# Altium project GNT604.PrjPcb
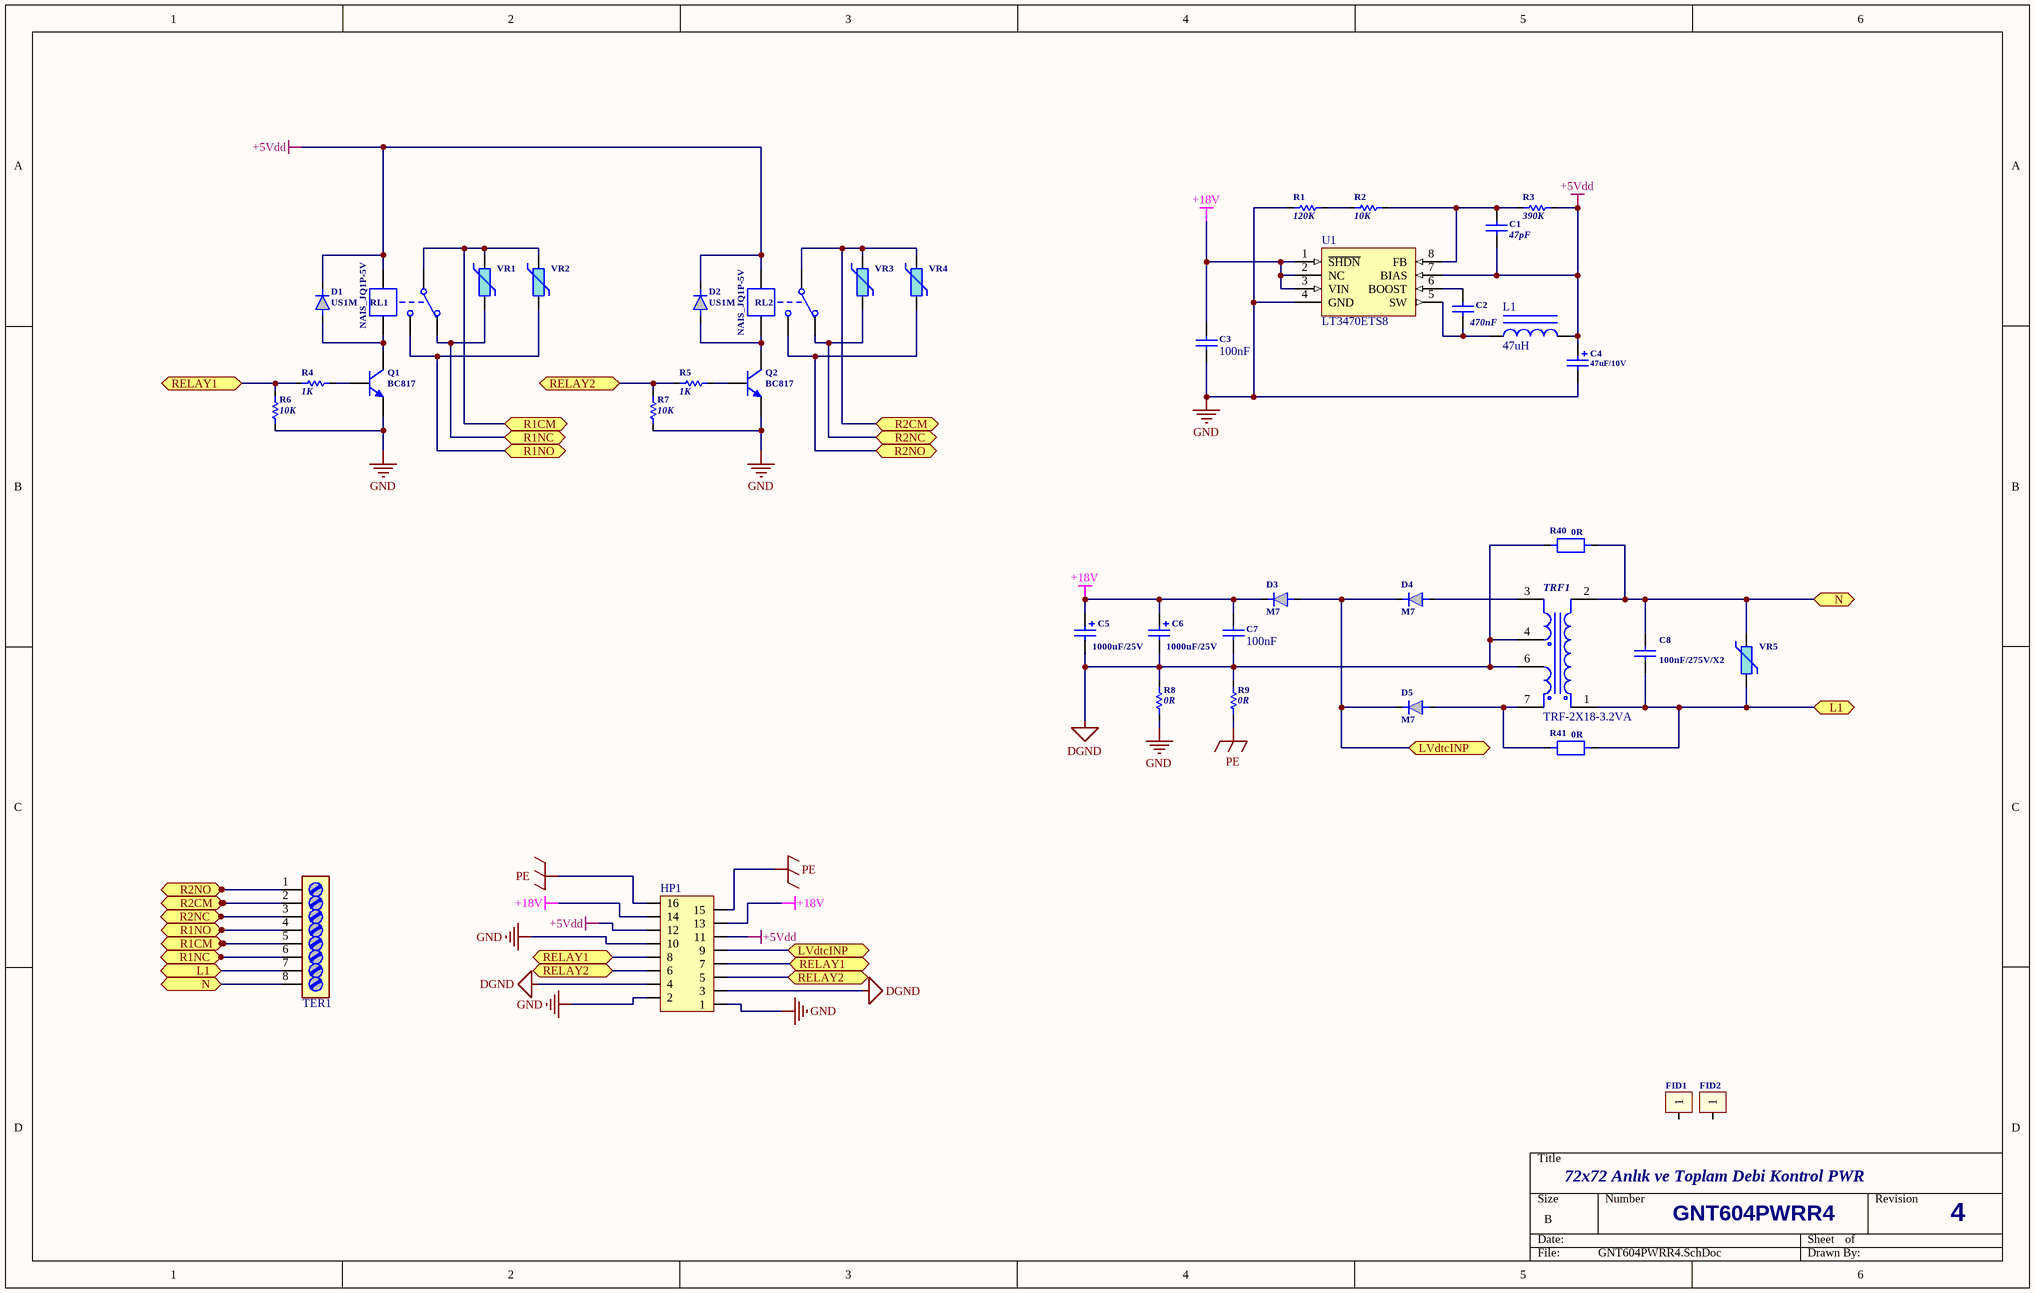
[diagram p0: GNT604PWRR4.SchDoc]
2 sheets, 139 parts. Net scope: flat (ports and power ports of the same name join across sheets).
Board files: GNT604CPUR4.PCBDOC, GNT604PWRR4.PCBDOC
Sheets:
  GNT604PWRR4.SchDoc
  GNT604CPUR4.SchDoc

## Sheet GNT604PWRR4.SchDoc
size B

### Parts
(Parts that share a designator on the sheet are numbered #1, #2 ... from top to bottom, then left to right.)
C1#1  47pF  [CC0805]
C2#1  470nF  [CC0805]
C3#1  100nF  [CC0805]
C4#1  47uF/10V  [CAPSMDTANTAL-B]
C5#1  1000uF/25V  [CAP5.08POL-10.16]
C6#1  1000uF/25V  [CAP5.08POL-10.16]
C7#1  100nF  [CC0805]
C8#1  100nF/275V/X2  [CAPAXIAL/275V/X2]
D1#1  US1M  [CD-SMA_DO214]
D2#1  US1M  [CD-SMA_DO214]
D3#1  M7  [CD-SMA_DO214]
D4#1  M7  [CD-SMA_DO214]
D5#1  M7  [CD-SMA_DO214]
FID1#1  FIDUCIAL1  [FIDUCIAL1]  (value not drawn)
FID2#1  FIDUCIAL1  [FIDUCIAL1]  (value not drawn)
HP1#1  DS1015-05_CONFLY  [HeaderAntenk90Pin16]  (value not drawn)
L1#1  47uH  [INDC2.5X3.3]
Q1#1  BC817  [SOT23_N]
Q2#1  BC817  [SOT23_N]
R1#1  120K  [CR0805]
R2#1  10K  [CR0805]
R3#1  390K  [CR0805]
R4#1  1K  [CR0805]
R5#1  1K  [CR0805]
R6#1  10K  [CR0805]
R7#1  10K  [CR0805]
R8#1  0R  [CR0805]
R9#1  0R  [CR0805]
R40  0R  [RES_AXIAL2W]
R41  0R  [RES_AXIAL2W]
RL1  NAIS_JQ1P-5V  [NAIS_JQ1P-XXV]
RL2  NAIS_JQ1P-5V  [NAIS_JQ1P-XXV]
TER1#1  Terminal_H5.08x8  [Terminal_H5.08x8]  (value not drawn)
TRF1  TRF-2X18-3.2VA  [TRF-EI38/13,5]
U1#1  LT3470ETS8  [TS8_N]
VR1  TVR07431  [TVR07431]  (value not drawn)
VR2  TVR07431  [TVR07431]  (value not drawn)
VR3  TVR07431  [TVR07431]  (value not drawn)
VR4  TVR07431  [TVR07431]  (value not drawn)
VR5  TVR07431  [TVR07431]  (value not drawn)

### Ports
L1 (bidir), LVdtcINP (bidir), N (bidir), R1CM (bidir), R1NC (bidir), R1NO (bidir), R2CM (bidir), R2NC (bidir), R2NO (bidir), RELAY1 (bidir), RELAY2 (bidir)

### Nets
+5Vdd: C1#1.2 C4#1.1(+) D1#1.2(K) D2#1.2(K) HP1#1.11 HP1#1.12 L1#1.2 R3#1.2 RL1.4(A1) RL2.4(A1) U1#1.7(BIAS)
+18V: C3#1.2 C5#1.1(+) C6#1.1(+) C7#1.2 D3#1.2(K) HP1#1.13 HP1#1.14 U1#1.1(~{SHDN}) U1#1.2(NC) U1#1.3(VIN)
DGND: C5#1.2(-) C6#1.2(-) C7#1.1 HP1#1.3 HP1#1.4 R8#1.1 R9#1.1 R40.1 TRF1.4(Sec1-) TRF1.6(Sec2+)
GND: C3#1.1 C4#1.2(-) HP1#1.1 HP1#1.2 HP1#1.10 Q1#1.2(E) Q2#1.2(E) R1#1.2 R6#1.2 R7#1.2 R8#1.2 U1#1.4(GND)
PE: HP1#1.15 HP1#1.16 R9#1.2
NetC1#1_1: C1#1.1 R2#1.1 R3#1.1 U1#1.8(FB)
NetC2#1_1: C2#1.1 U1#1.6(BOOST)
NetC2#1_2: C2#1.2 L1#1.1 U1#1.5(SW)
NetC8#1_1: C8#1.1 R40.2 TER1#1.8 TRF1.2(Pri-) VR5.2 ; port N
NetC8#1_2: C8#1.2 R41.2 TER1#1.7 TRF1.1(Pri+) VR5.1 ; port L1
NetD1#1_1: D1#1.1(A) Q1#1.3(C) RL1.5(A2)
NetD2#1_1: D2#1.1(A) Q2#1.3(C) RL2.5(A2)
NetD3#1_1: D3#1.1(A) D4#1.2(K) D5#1.2(K) HP1#1.9 ; port LVdtcINP
NetD4#1_1: D4#1.1(A) TRF1.3(Sec1+)
NetD5#1_1: D5#1.1(A) R41.1 TRF1.7(Sec2-)
NetHP1#1_5: HP1#1.5 HP1#1.6 R5#1.2 R7#1.1 ; port RELAY2
NetHP1#1_7: HP1#1.7 HP1#1.8 R4#1.2 R6#1.1 ; port RELAY1
NetQ1#1_1: Q1#1.1(B) R4#1.1
NetQ2#1_1: Q2#1.1(B) R5#1.1
NetR1#1_1: R1#1.1 R2#1.2
NetRL1_1: RL1.1(COM) TER1#1.5 VR1.2 VR2.2 ; port R1CM
NetRL1_2: RL1.2(NC) TER1#1.6 VR1.1 ; port R1NC
NetRL1_3: RL1.3(NO) TER1#1.4 VR2.1 ; port R1NO
NetRL2_1: RL2.1(COM) TER1#1.2 VR3.2 VR4.2 ; port R2CM
NetRL2_2: RL2.2(NC) TER1#1.3 VR3.1 ; port R2NC
NetRL2_3: RL2.3(NO) TER1#1.1 VR4.1 ; port R2NO

Not connected (* = marked no-connect by the designer): FID1#1 1; FID2#1 1

### Notes on the sheet
- 72x72 Anlık ve Toplam Debi Kontrol PWR
- GNT604PWRR4
- 4

### Library data of the parts
C1#1 C2#1 = CC-0805: Ceramic Chip Capacitor - Standard; Note: Footprint corresponds to dimensions for bulk cassette packaging. This case size has tightened tolerances.; Value: 100nF; Published: 17-Jul-2002; LatestRevisionDate: 19-Mar-2004; LatestRevisionNote: Silkscreen size reduced.; DatasheetDocument: Mar-2001; PackageDocument: Mar-2001; PackageReference: 0805; Publisher: Altium Limited; Code_JEITA: 0805; Code_IPC: 2012[0805]; ComponentLink1Description: Manufacturer Link; ComponentLink1URL: http://www.kemet.com/; ComponentLink2Description: Datasheet; ComponentLink2URL: http://www.kemet.com/kemet/web/homepage/kechome.nsf/vapubfilesname/F3102TA.pdf/$file/F3102TA.pdf
C3#1 C7#1 = CC-0805: Ceramic Chip Capacitor - Standard
C4#1 = CAPSMDTANTAL-B: CA45 Chip Tantalum Capacitors; Published: *; Publisher: *; Manufacturer: *; Class: *; SubClass: *
C5#1 C6#1 = CAP AXIAL POL10.16: Polarized Capacitor - Standard
C8#1 = CAP AXIAL SER: Ceramic Capacitor - Standard
D1#1 D2#1 = US1M: ChipDiodeSMA, ultra fast diode
D3#1 D4#1 D5#1 = CD-SMA_DO214: ChipDiodeSMA
HP1#1 = Header Antenk90PinF16: Header, 16-Pin, 90 DEGREES; Revision: 17-Jul-2002: Re-released for DXP Platform.; Publisher: Altium Limited
L1#1 = Inductor Iron_47uH: Magnetic-Core Inductor_SMD; Published: 24-Mar-1999; Revision: July-2002: Re-released for DXP Platform.; Publisher: Altium Limited
Q1#1 Q2#1 = BC817-40: NPN General Purpose Amplifier; Text Field7: Published 29-Sep-2000
R1#1 R2#1 R3#1 R4#1 R5#1 R6#1 R7#1 R8#1 R9#1 = CR-0805: ChipResistor0805; Published: 8-Jun-2000; LatestRevisionDate: 17-Jul-2002; LatestRevisionNote: Re-released for DXP Platform.; PackageReference: AXIAL-0.3; Publisher: Altium Limited
R40 R41 = RESISTOR AXIAL 2W: Axial Resistor 2W
RL1 RL2 = NAIS_JQ1P-24V: Single-Pole Dual-Throw Relay; Published: 24-Mar-1999; Revision: July-2002: Re-released for DXP Platform.; Publisher: Altium Limited
TER1#1 = Terminal_H5.08x8: Terminal Block Horizontal 5.08mm 8 pin
TRF1 = TRF-2X18-3.2VA: Text Field7: Published 8-Jun-2000
U1#1 = LT3470ETS8: 200mA, Micropower Buck Regulator; Note: 1916; Published: 30-May-2008; DatasheetVersion: Aug-2007; PackageVersion: revA, 2000; PackageReference: MS8; Publisher: Altium Limited; PackageDescription: 8-Pin Thin Small Outline Package 0.65 mm Pitch; ComponentLink1Description: Manufacturer Link; ComponentLink1URL: http://www.linear.com/; ComponentLink2Description: Datasheet; ComponentLink2URL: http://www.linear.com/pc/downloadDocument.do?navId=H0,C1,C1003,C1040,C1055,P1378,D3343
VR1-VR5 = TVR07431: Varistor (Voltage-Sensitive Resistor)-275V; Published: 24-Mar-1999; Revision: July-2002: Re-released for DXP Platform.; Publisher: Altium Limited

## Sheet GNT604CPUR4.SchDoc
size B
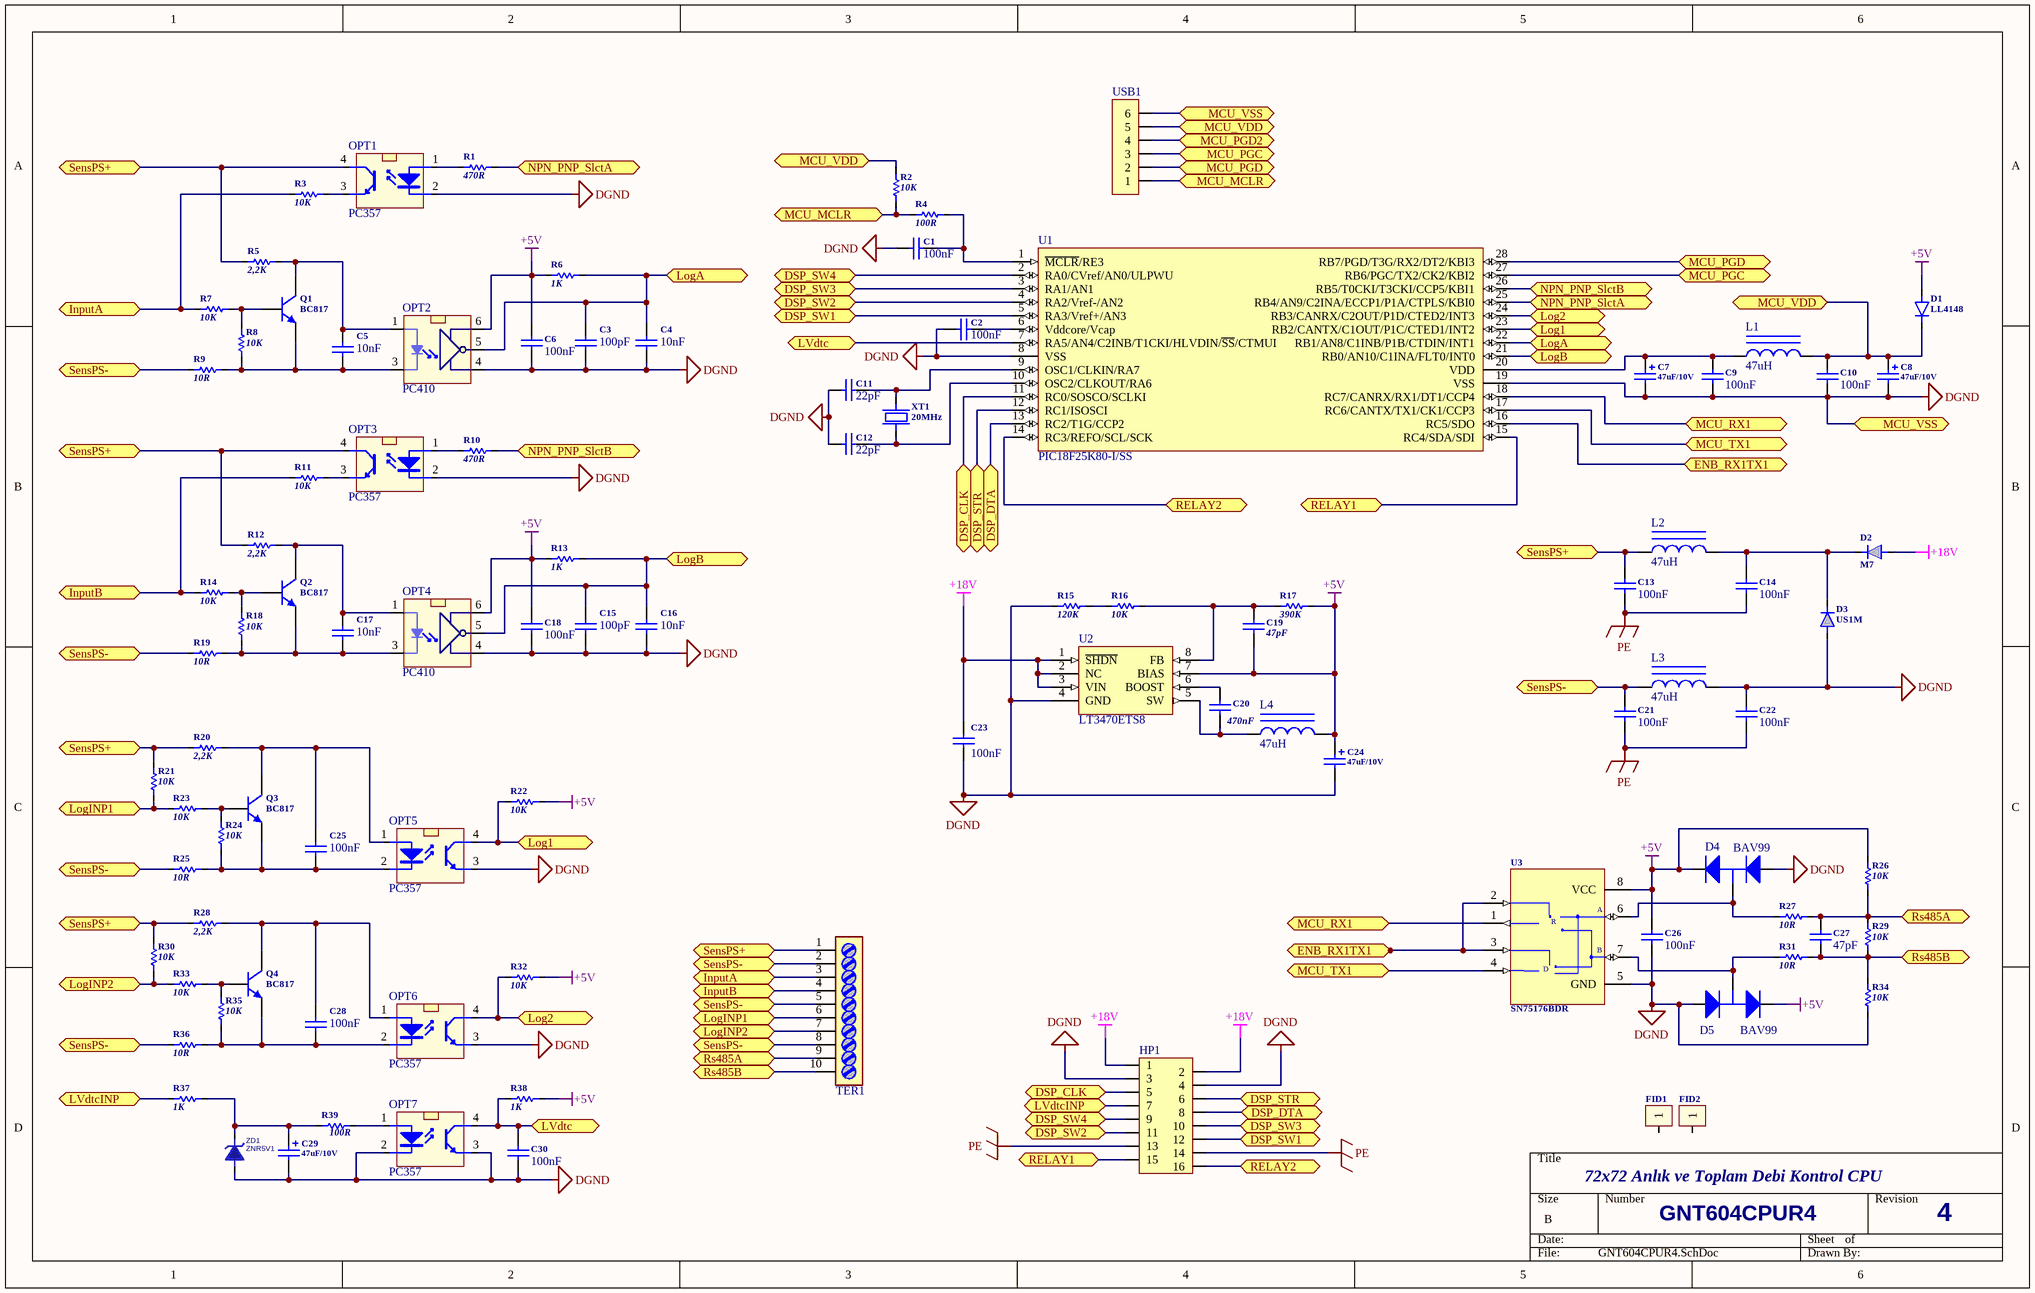
[diagram p1: GNT604CPUR4.SchDoc]

### Parts
(Parts that share a designator on the sheet are numbered #1, #2 ... from top to bottom, then left to right.)
C1#2  100nF  [CC0805]
C2#2  100nF  [CC0805]
C3#2  100pF  [CC0805]
C4#2  10nF  [CC0805]
C5#2  10nF  [CC0805]
C6#2  100nF  [CC0805]
C7#2  47uF/10V  [CAPSMDTANTAL-B]
C8#2  47uF/10V  [CAPSMDTANTAL-B]
C9  100nF  [CC0805]
C10  100nF  [CC0805]
C11  22pF  [CC0805]
C12  22pF  [CC0805]
C13  100nF  [CC0805]
C14  100nF  [CC0805]
C15  100pF  [CC0805]
C16  10nF  [CC0805]
C17  10nF  [CC0805]
C18  100nF  [CC0805]
C19  47pF  [CC0805]
C20  470nF  [CC0805]
C21  100nF  [CC0805]
C22  100nF  [CC0805]
C23  100nF  [CC0805]
C24  47uF/10V  [CAPSMDTANTAL-B]
C25  100nF  [CC0805]
C26  100nF  [CC0805]
C27  47pF  [CC0805]
C28  100nF  [CC0805]
C29  47uF/10V  [CAPSMDTANTAL-B]
C30  100nF  [CC0805]
D1#2  LL4148  [CD-SOD80]
D2#2  M7  [CD-SMA_DO214]
D3#2  US1M  [CD-SMA_DO214]
D4#2  BAV99  [SOT23_N]
D5#2  BAV99  [SOT23_N]
FID1#2  FIDUCIAL1  [FIDUCIAL1]  (value not drawn)
FID2#2  FIDUCIAL1  [FIDUCIAL1]  (value not drawn)
HP1#2  DS1015-05_CONFLY  [HeaderAntenk90Pin16]  (value not drawn)
L1#2  47uH  [INDC2.5X3.3]
L2  47uH  [INDC2.5X3.3]
L3  47uH  [INDC2.5X3.3]
L4  47uH  [INDC2.5X3.3]
OPT1  PC357  [SO-4]
OPT2  PC410  [SO-5]
OPT3  PC357  [SO-4]
OPT4  PC410  [SO-5]
OPT5  PC357  [SO-4]
OPT6  PC357  [SO-4]
OPT7  PC357  [SO-4]
Q1#2  BC817  [SOT23_N]
Q2#2  BC817  [SOT23_N]
Q3  BC817  [SOT23_N]
Q4  BC817  [SOT23_N]
R1#2  470R  [CR0805]
R2#2  10K  [CR0805]
R3#2  10K  [CR0805]
R4#2  100R  [CR0805]
R5#2  2,2K  [CR0805]
R6#2  1K  [CR0805]
R7#2  10K  [CR0805]
R8#2  10K  [CR0805]
R9#2  10R  [CR0805]
R10  470R  [CR0805]
R11  10K  [CR0805]
R12  2,2K  [CR0805]
R13  1K  [CR0805]
R14  10K  [CR0805]
R15  120K  [CR0805]
R16  10K  [CR0805]
R17  390K  [CR0805]
R18  10K  [CR0805]
R19  10R  [CR0805]
R20  2,2K  [CR0805]
R21  10K  [CR0805]
R22  10K  [CR0805]
R23  10K  [CR0805]
R24  10K  [CR0805]
R25  10R  [CR0805]
R26  10K  [CR0805]
R27  10R  [CR0805]
R28  2,2K  [CR0805]
R29  10K  [CR0805]
R30  10K  [CR0805]
R31  10R  [CR0805]
R32  10K  [CR0805]
R33  10K  [CR0805]
R34  10K  [CR0805]
R35  10K  [CR0805]
R36  10R  [CR0805]
R37  1K  [CR0805]
R38  1K  [CR0805]
R39  100R  [CR0805]
TER1#2  Terminal_H5.08x10  [Terminal_H5.08x10]  (value not drawn)
U1#2  PIC18F25K80-I/SS  [SSOP-SS28_N]
U2  LT3470ETS8  [TS8_N]
U3  SN75176BDR  [SO-8]
USB1  USB_MICRO  [MICRO_USB]  (value not drawn)
XT1  20MHz  [HC49/4H_SMX]
ZD1  ZNR5V1  [SOT23_N]

### Ports
DSP_CLK (bidir), DSP_DTA (bidir), DSP_STR (bidir), DSP_SW1 (bidir), DSP_SW2 (bidir), DSP_SW3 (bidir), DSP_SW4 (bidir), ENB_RX1TX1 (bidir), InputA (bidir), InputB (bidir), Log1 (bidir), Log2 (bidir), LogA (bidir), LogB (bidir), LogINP1 (bidir), LogINP2 (bidir), LVdtc (bidir), LVdtcINP (bidir), MCU_MCLR (bidir), MCU_PGC (bidir), MCU_PGD2 (bidir), MCU_PGD (bidir), MCU_RX1 (bidir), MCU_TX1 (bidir), MCU_VDD (bidir), MCU_VSS (bidir), NPN_PNP_SlctA (bidir), NPN_PNP_SlctB (bidir), RELAY1 (bidir), RELAY2 (bidir), Rs485A (bidir), Rs485B (bidir), SensPS+ (bidir), SensPS- (bidir)

### Nets
+5V: C6#2.1 C18.1 C19.2 C24.1(+) C26.1 D1#2.1(A) D4#2.2(K2) D5#2.2(K2) L4.2 OPT2.6 OPT4.6 R6#2.2 R13.2 R17.2 R22.2 R26.1 R32.2 R38.2 U2.7(BIAS) U3.8(VCC)
+18V: C23.2 D2#2.1(A) HP1#2.1 HP1#2.2 U2.1(~{SHDN}) U2.2(NC) U2.3(VIN)
DGND: C1#2.2 C2#2.2 C3#2.2 C4#2.2 C6#2.2 C7#2.2(-) C8#2.2(-) C9.1 C10.1 C11.2 C12.2 C15.2 C16.2 C18.2 C22.2 C23.1 C24.2(-) C26.2 C29.2(-) C30.2 D3#2.1(A) D4#2.1(A1) D5#2.1(A1) HP1#2.3 HP1#2.4 L3.2 OPT1.2(K) OPT2.4 OPT3.2(K) OPT4.4 OPT5.3(E) OPT6.3(E) OPT7.2(K) OPT7.3(E) R15.2 R34.2 U1#2.8(VSS) U1#2.19(VSS) U2.4(GND) U3.5(GND) USB1.6 ZD1.1(A) ; port MCU_VSS
PE: C13.1 C14.1 C21.1 C22.1 HP1#2.13 HP1#2.14
NetC1#2_1: C1#2.1 R4#2.1 U1#2.1(~{MCLR}/RE3)
NetC2#2_1: C2#2.1 U1#2.6(Vddcore/Vcap)
NetC3#2_1: C3#2.1 C4#2.1 OPT2.5 R6#2.1 U1#2.22(RB1/AN8/C1INB/P1B/CTDIN/INT1) ; port LogA
NetC5#2_1: C5#2.1 OPT2.1 Q1#2.3(C) R5#2.1
NetC5#2_2: C5#2.2 OPT2.3 Q1#2.2(E) R8#2.2 R9#2.1
NetC7#2_1: C7#2.1(+) C9.2 L1#2.1 U1#2.20(VDD)
NetC8#2_1: C8#2.1(+) C10.2 D1#2.2(K) L1#2.2 R2#2.1 USB1.5 ; port MCU_VDD
NetC11_1: C11.1 U1#2.9(OSC1/CLKIN/RA7) XT1.1
NetC12_1: C12.1 U1#2.10(OSC2/CLKOUT/RA6) XT1.2
NetC13_2: C13.2 L2.1 OPT1.4(C) OPT3.4(C) R5#2.2 R12.2 R20.1 R21.1 R28.1 R30.1 TER1#2.1 ; port SensPS+
NetC14_2: C14.2 D2#2.2(K) D3#2.2(K) L2.2
NetC15_1: C15.1 C16.1 OPT4.5 R13.1 U1#2.21(RB0/AN10/C1INA/FLT0/INT0) ; port LogB
NetC17_1: C17.1 OPT4.1 Q2#2.3(C) R12.1
NetC17_2: C17.2 OPT4.3 Q2#2.2(E) R18.2 R19.1
NetC19_1: C19.1 R16.1 R17.1 U2.8(FB)
NetC20_1: C20.1 U2.6(BOOST)
NetC20_2: C20.2 L4.1 U2.5(SW)
NetC21_2: C21.2 L3.1 R9#2.2 R19.2 R25.2 R36.2 TER1#2.2 TER1#2.5 TER1#2.8 ; port SensPS-
NetC25_1: C25.1 OPT5.1(A) Q3.3(C) R20.2
NetC25_2: C25.2 OPT5.2(K) Q3.2(E) R24.2 R25.1
NetC27_1: C27.1 R29.2 R31.1 R34.1 TER1#2.10 ; port Rs485B
NetC27_2: C27.2 R26.2 R27.1 R29.1 TER1#2.9 ; port Rs485A
NetC28_1: C28.1 OPT6.1(A) Q4.3(C) R28.2
NetC28_2: C28.2 OPT6.2(K) Q4.2(E) R35.2 R36.1
NetC29_1: C29.1(+) R37.2 R39.1 ZD1.3(K)
NetC30_1: C30.1 OPT7.4(C) R38.1 U1#2.7(RA5/AN4/C2INB/T1CKI/HLVDIN/~{SS}/CTMUI) ; port LVdtc
NetD3#1_1: HP1#2.7 R37.1 ; port LVdtcINP
NetD4#2_3: D4#2.3(AK) R27.2 U3.6(A)
NetD5#2_3: D5#2.3(AK) R31.2 U3.7(B)
NetHP1#1_5: HP1#2.16 U1#2.14(RC3/REFO/SCL/SCK) ; port RELAY2
NetHP1#1_7: HP1#2.15 U1#2.15(RC4/SDA/SDI) ; port RELAY1
NetHP1#2_5: HP1#2.5 U1#2.11(RC0/SOSCO/SCLKI) ; port DSP_CLK
NetHP1#2_6: HP1#2.6 U1#2.12(RC1/ISOSCI) ; port DSP_STR
NetHP1#2_8: HP1#2.8 U1#2.13(RC2/T1G/CCP2) ; port DSP_DTA
NetHP1#2_9: HP1#2.9 U1#2.2(RA0/CVref/AN0/ULPWU) ; port DSP_SW4
NetHP1#2_10: HP1#2.10 U1#2.3(RA1/AN1) ; port DSP_SW3
NetHP1#2_11: HP1#2.11 U1#2.4(RA2/Vref-/AN2) ; port DSP_SW2
NetHP1#2_12: HP1#2.12 U1#2.5(RA3/Vref+/AN3) ; port DSP_SW1
NetOPT1_1: OPT1.1(A) R1#2.2
NetOPT1_3: OPT1.3(E) R3#2.2
NetOPT3_1: OPT3.1(A) R10.2
NetOPT3_3: OPT3.3(E) R11.2
NetOPT5_4: OPT5.4(C) R22.1 U1#2.23(RB2/CANTX/C1OUT/P1C/CTED1/INT2) ; port Log1
NetOPT6_4: OPT6.4(C) R32.1 U1#2.24(RB3/CANRX/C2OUT/P1D/CTED2/INT3) ; port Log2
NetOPT7_1: OPT7.1(A) R39.2
NetQ1#2_1: Q1#2.1(B) R7#2.1 R8#2.1
NetQ2#2_1: Q2#2.1(B) R14.1 R18.1
NetQ3_1: Q3.1(B) R23.2 R24.1
NetQ4_1: Q4.1(B) R33.2 R35.1
NetR1#2_1: R1#2.1 U1#2.25(RB4/AN9/C2INA/ECCP1/P1A/CTPLS/KBI0) ; port NPN_PNP_SlctA
NetR2#2_2: R2#2.2 R4#2.2 USB1.1 ; port MCU_MCLR
NetR3#2_1: R3#2.1 R7#2.2 TER1#2.3 ; port InputA
NetR10_1: R10.1 U1#2.26(RB5/T0CKI/T3CKI/CCP5/KBI1) ; port NPN_PNP_SlctB
NetR11_1: R11.1 R14.2 TER1#2.4 ; port InputB
NetR15_1: R15.1 R16.2
NetR21_2: R21.2 R23.1 TER1#2.6 ; port LogINP1
NetR30_2: R30.2 R33.1 TER1#2.7 ; port LogINP2
NetU1#2_16: U1#2.16(RC5/SDO) U3.2(~{RE}) U3.3(DE) ; port ENB_RX1TX1
NetU1#2_17: U1#2.17(RC6/CANTX/TX1/CK1/CCP3) U3.4(DI) ; port MCU_TX1
NetU1#2_18: U1#2.18(RC7/CANRX/RX1/DT1/CCP4) U3.1(RO) ; port MCU_RX1
NetU1#2_27: U1#2.27(RB6/PGC/TX2/CK2/KBI2) USB1.3 ; port MCU_PGC
NetU1#2_28: U1#2.28(RB7/PGD/T3G/RX2/DT2/KBI3) USB1.2 ; port MCU_PGD
NetUSB1_4: USB1.4 ; port MCU_PGD2

Not connected (* = marked no-connect by the designer): FID1#2 1; FID2#2 1

### Notes on the sheet
- 72x72 Anlık ve Toplam Debi Kontrol CPU
- GNT604CPUR4
- 4
- (in symbol SN75176BDR) R; D

### Library data of the parts
C1#2 C2#2 C3#2 C4#2 C5#2 C6#2 C9-C18 C21-C23 C25-C28 C30 = CC-0805: Ceramic Chip Capacitor - Standard
C7#2 C8#2 C24 C29 = CAPSMDTANTAL-B: CA45 Chip Tantalum Capacitors; Published: *; Publisher: *; Manufacturer: *; Class: *; SubClass: *
C19 C20 = CC-0805: as C1#1 on sheet GNT604PWRR4; Published: 17-Jul-2002; LatestRevisionDate: 19-Mar-2004; LatestRevisionNote: Silkscreen size reduced.; DatasheetDocument: Mar-2001; PackageDocument: Mar-2001; PackageReference: 0805; Publisher: Altium Limited; Code_JEITA: 0805; Code_IPC: 2012[0805]; ComponentLink1Description: Manufacturer Link; ComponentLink1URL: http://www.kemet.com/; ComponentLink2Description: Datasheet; ComponentLink2URL: http://www.kemet.com/kemet/web/homepage/kechome.nsf/vapubfilesname/F3102TA.pdf/$file/F3102TA.pdf
D1#2 = CD-SOD80: ChipDiode-MiniMELF-SOD80
D2#2 = CD-SMA_DO214: ChipDiodeSMA
D3#2 = US1M: ChipDiodeSMA, ultra fast diode
D4#2 D5#2 = BAV99: Ultrafast, Soft Recovery Diode
HP1#2 = Header Antenk90PinF16: Header, 16-Pin, 90 DEGREES; Revision: 17-Jul-2002: Re-released for DXP Platform.; Publisher: Altium Limited
L1#2 L2-L4 = Inductor Iron_47uH: Magnetic-Core Inductor_SMD; Published: 24-Mar-1999; Revision: July-2002: Re-released for DXP Platform.; Publisher: Altium Limited
OPT1 OPT3 OPT5-OPT7 = PC357: Optoisolator
OPT2 OPT4 = PC410: Ultra-high Speed Response  OPIC Photocoupler
Q1#2 Q2#2 Q3 Q4 = BC817-40: as Q1#1 on sheet GNT604PWRR4
R1#2 R2#2 R3#2 R4#2 R5#2 R6#2 R7#2 R8#2 R9#2 R10-R39 = CR-0805: ChipResistor0805; Published: 8-Jun-2000; LatestRevisionDate: 17-Jul-2002; LatestRevisionNote: Re-released for DXP Platform.; PackageReference: AXIAL-0.3; Publisher: Altium Limited
TER1#2 = Terminal_H5.08x10: Terminal Block Horizontal 5.08mm 10 pin
U1#2 = PIC18F25K80-I/SS: Flash Microcontroller with 10-Bit A/D and nanoWatt Technology, 32K Flash, 28-Pin SSOP, Industrial Temperature Range, Tape and Reel; FirstPublished: 29-Jan-2009; LatestRevisionDate: 02-Dec-2009; LatestRevisionNote: Updated to datasheet revision F, Sep-2009; DatasheetVersion: revF, Sep-2009; PackageVersion: revBB, Aug-2009; PackageReference: SSOP-SS28; Publisher: Altium Limited; PackageDescription: 28-Lead Plastic Shrink Small Outline (SS) - 5.3mm Body [SSOP]; Supplier 1: Digi-Key; Supplier Part Number 1: PIC18F25K20T-I/SSTR-ND; Supplier 2: Digi-Key; Supplier Part Number 2: PIC18F25K20T-I/SSCT-ND; Supplier 3: Digi-Key; Supplier Part Number 3: PIC18F25K20T-I/SSDKR-ND; Supplier 4: Newark; Supplier Part Number 4: 88K5991; Code_JEDEC: MS-150; Code_IPC: SOP65P780-28; ComponentLink1Description: Datasheet; ComponentLink1URL: http://ww1.microchip.com/downloads/en/DeviceDoc/41303F.pdf; ComponentLink2Description: Packaging Specification; ComponentLink2URL: http://www.microchip.com/stellent/groups/techpub_sg/documents/packagingspec/en012702.pdf; ComponentLink3Description: Microchip.com Home; ComponentLink3URL: http://www.microchip.com/
U2 = LT3470ETS8: as U1#1 on sheet GNT604PWRR4; Published: 30-May-2008; DatasheetVersion: Aug-2007; PackageVersion: revA, 2000; PackageReference: MS8; Publisher: Altium Limited; PackageDescription: 8-Pin Thin Small Outline Package 0.65 mm Pitch; ComponentLink1Description: Manufacturer Link; ComponentLink1URL: http://www.linear.com/; ComponentLink2Description: Datasheet; ComponentLink2URL: http://www.linear.com/pc/downloadDocument.do?navId=H0,C1,C1003,C1040,C1055,P1378,D3343
U3 = SN75176BDR: Low-Power,RS-485/RS-422 Transceiver; PackageDocument: RevB, 21-0043; Published: 16-Jan-2001; LatestRevisionDate: 6-Jun-2005; LatestRevisionNote: Stylized 3D Model Added.; DatasheetDocument: Feb-1996; PackageReference: PA8; Publisher: Altium Limited; Code_JEDEC: MS-001-AB; ComponentLink1Description: Manufacturer Link; ComponentLink1URL: http://www.maxim-ic.com/; ComponentLink2Description: Datasheet; ComponentLink2URL: http://pdfserv.maxim-ic.com/en/ds/MAX1487-MAX491.pdf
USB1 = USB_MICRO: Connector; USB2.0, Type A, SM; 5 Position; Right Angle; Revision: 17-Jul-2002: Re-released for DXP Platform.; Publisher: Altium Limited
XT1 = XTALL_SMD: HS-XTALL(SMD)
ZD1 = ZENER2-SOT23: Zener Diode

## Nets that join several sheets
+18V: GNT604PWRR4 (10 pins), GNT604CPUR4 (7 pins)
DGND: GNT604PWRR4 (10 pins), GNT604CPUR4 (42 pins)
PE: GNT604PWRR4 (HP1#1.15 HP1#1.16 R9#1.2), GNT604CPUR4 (6 pins)
NetD3#1_1: GNT604PWRR4 (D3#1.1 D4#1.2 D5#1.2 HP1#1.9), GNT604CPUR4 (HP1#2.7 R37.1)
NetHP1#1_5: GNT604PWRR4 (HP1#1.5 HP1#1.6 R5#1.2 R7#1.1), GNT604CPUR4 (HP1#2.16 U1#2.14)
NetHP1#1_7: GNT604PWRR4 (HP1#1.7 HP1#1.8 R4#1.2 R6#1.1), GNT604CPUR4 (HP1#2.15 U1#2.15)